# Altium schematic sheet a0206-2006.5.SchDoc
size 558 x 431 mm
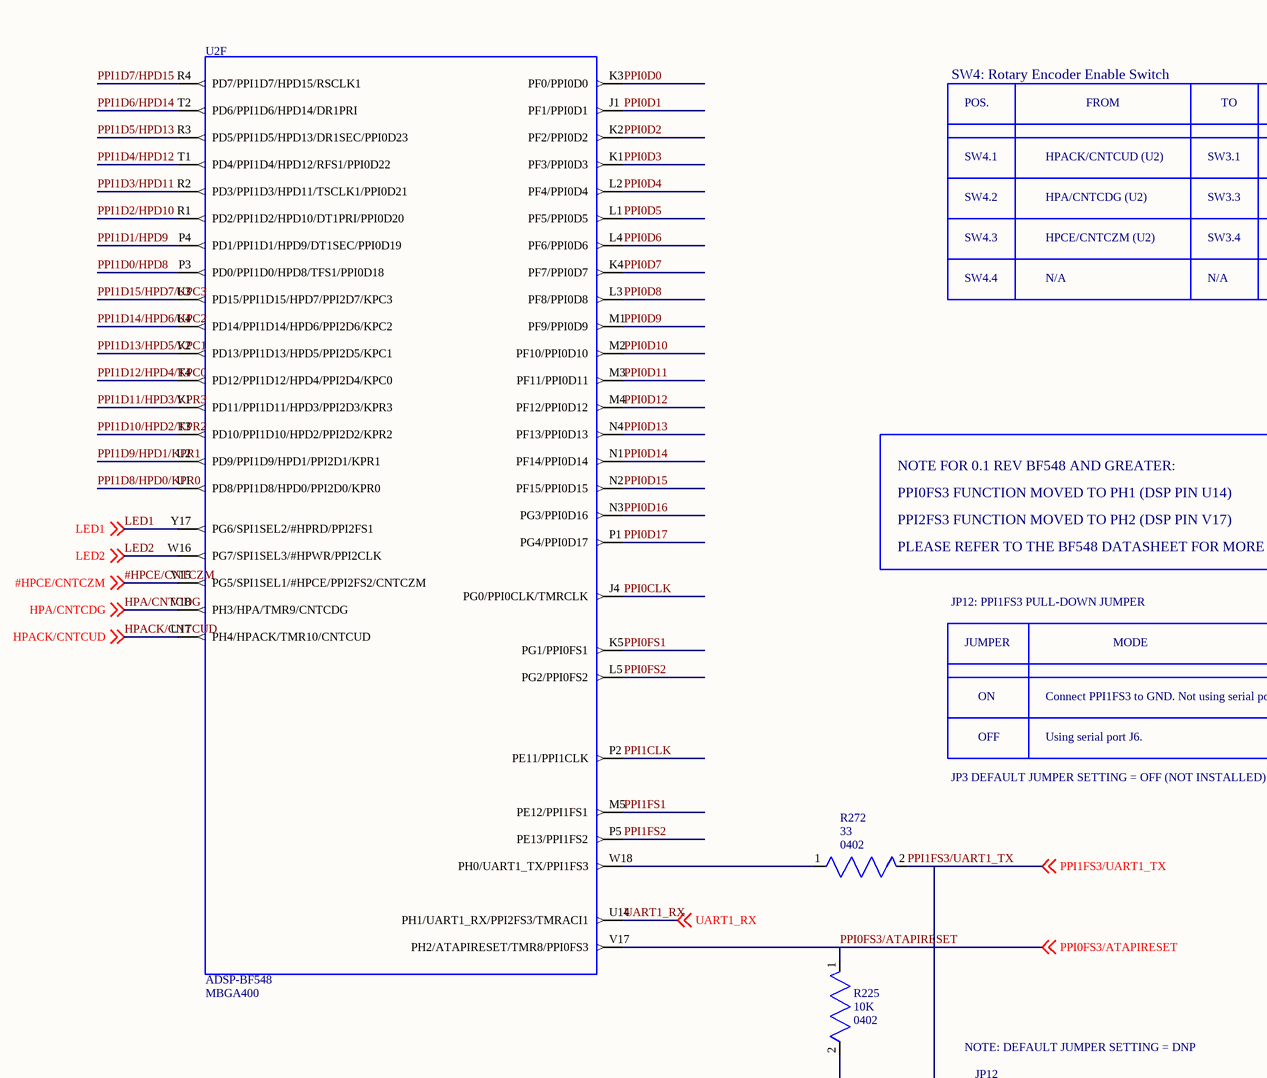
[diagram p0: a0206-2006.5.SchDoc, top left]
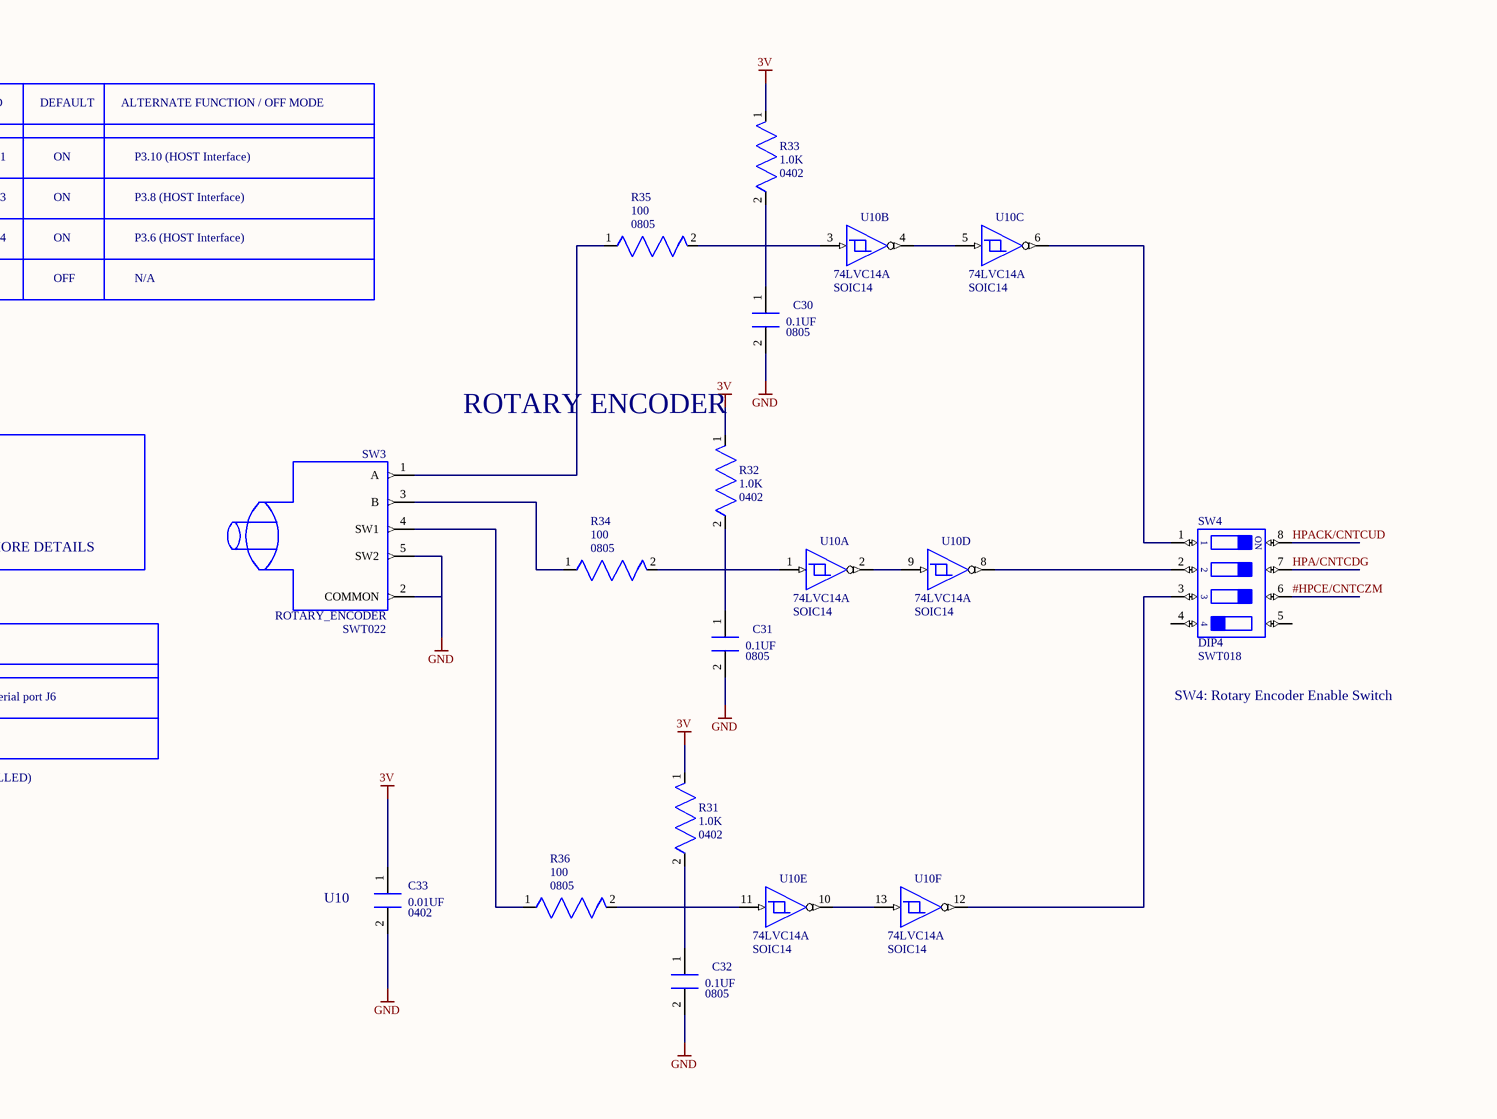
[diagram p1: a0206-2006.5.SchDoc, top right]
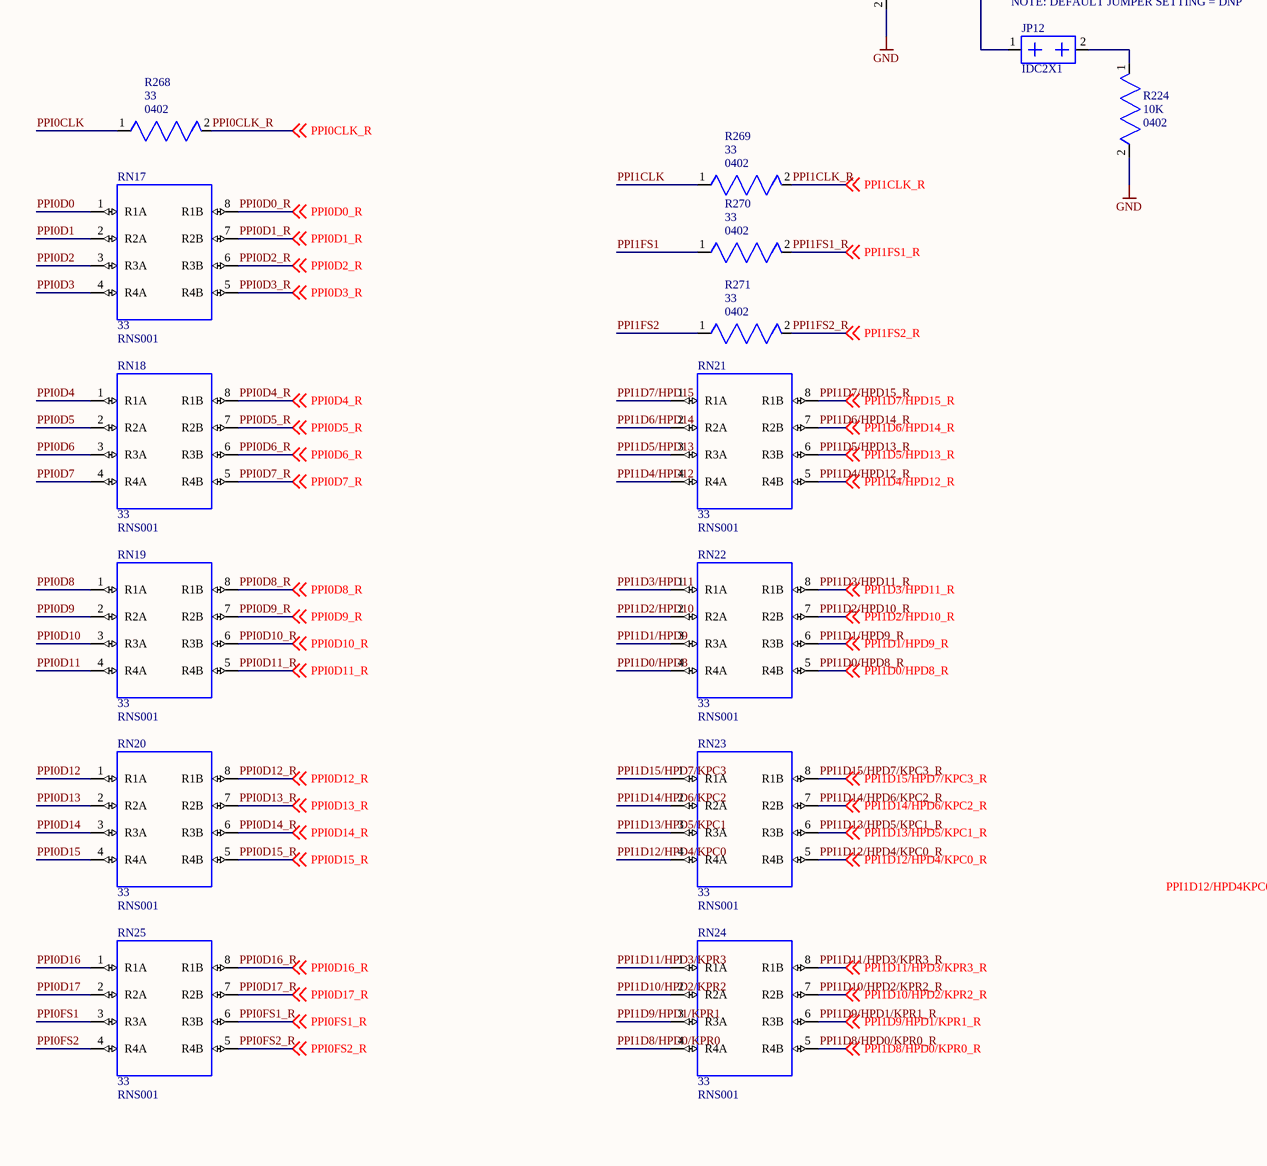
[diagram p2: a0206-2006.5.SchDoc, bottom left]
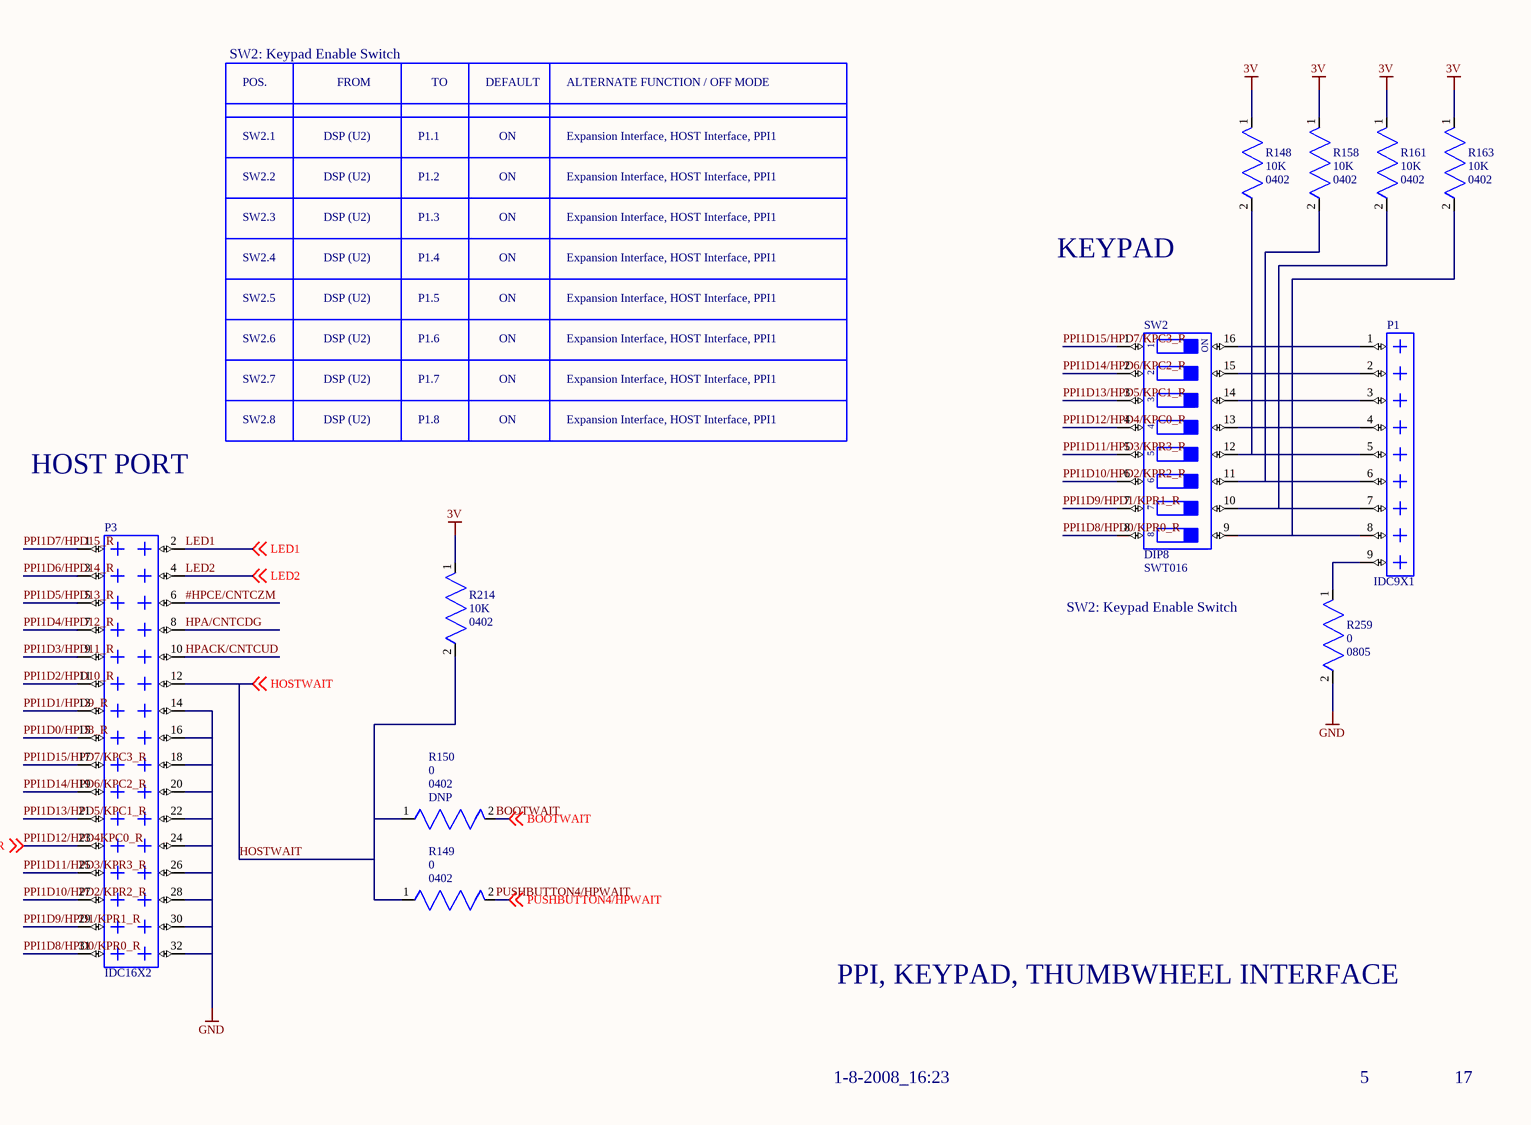
[diagram p3: a0206-2006.5.SchDoc, bottom right]

## Parts
C30  value 0.1UF  [0805]  (hidden comment: *)
C31  value 0.1UF  [0805]  (hidden comment: *)
C32  value 0.1UF  [0805]  (hidden comment: *)
C33  value 0.01UF  [0402]  (hidden comment: *)
JP12  *  [IDC2X1]  (value not drawn)
P1  *  [IDC9X1]  (value not drawn)
P3  *  [IDC16X2]  (value not drawn)
R31  value 1.0K  [0402]  (hidden comment: *)
R32  value 1.0K  [0402]  (hidden comment: *)
R33  value 1.0K  [0402]  (hidden comment: *)
R34  value 100  [0805]  (hidden comment: *)
R35  value 100  [0805]  (hidden comment: *)
R36  value 100  [0805]  (hidden comment: *)
R148  value 10K  [0402]  (hidden comment: *)
R149  value 0  [0402]  (hidden comment: *)
R150  value 0  CLASS: DNP  [0402]  (hidden comment: *)
R158  value 10K  [0402]  (hidden comment: *)
R161  value 10K  [0402]  (hidden comment: *)
R163  value 10K  [0402]  (hidden comment: *)
R214  value 10K  [0402]  (hidden comment: *)
R224  value 10K  [0402]  (hidden comment: *)
R225  value 10K  [0402]  (hidden comment: *)
R259  value 0  [0805]  (hidden comment: *)
R268  value 33  [0402]  (hidden comment: *)
R269  value 33  [0402]  (hidden comment: *)
R270  value 33  [0402]  (hidden comment: *)
R271  value 33  [0402]  (hidden comment: *)
R272  value 33  [0402]  (hidden comment: *)
RN17  value 33  [RNS001]  (hidden comment: *)
RN18  value 33  [RNS001]  (hidden comment: *)
RN19  value 33  [RNS001]  (hidden comment: *)
RN20  value 33  [RNS001]  (hidden comment: *)
RN21  value 33  [RNS001]  (hidden comment: *)
RN22  value 33  [RNS001]  (hidden comment: *)
RN23  value 33  [RNS001]  (hidden comment: *)
RN24  value 33  [RNS001]  (hidden comment: *)
RN25  value 33  [RNS001]  (hidden comment: *)
SW2  value DIP8  [SWT016]  (hidden comment: *)
SW3  value ROTARY_ENCODER  [SWT022]  (hidden comment: *)
SW4  value DIP4  [SWT018]  (hidden comment: *)
U2  PART: ADSP-BF548  PKG_TYPE: MBGA400  (hidden comment: ICS_ADSPBF548)  (part F of 7)
U10  PART: 74LVC14A  [SOIC14]  (hidden comment: *)  (parts A,B,C,D,E,F of 6)

## Nets
3V: C33.1(A) R31.1(N1) R32.1(N1) R33.1(N1) R148.1(N1) R158.1(N1) R161.1(N1) R163.1(N1) R214.1(N1) U10.14(3V)
GND: C30.2(B) C31.2(B) C32.2(B) C33.2(B) P3.14 P3.16 P3.18 P3.20 P3.22 P3.24 P3.26 P3.28 P3.30 P3.32 R224.2(N2) R225.2(N2) R259.2(N2) SW3.2(COMMON) SW3.5(SW2) U10.7(GND)
#HPCE/CNTCZM: P3.6 SW4.6 U2.V15(PG5/SPI1SEL1/#HPCE/PPI2FS2/CNTCZM) ; off-sheet #HPCE/CNTCZM
BOOTWAIT: R150.2(N2) ; off-sheet BOOTWAIT
HOSTWAIT: P3.12 R149.1(N1) R150.1(N1) R214.2(N2) ; off-sheet HOSTWAIT
HPA/CNTCDG: P3.8 SW4.7 U2.V18(PH3/HPA/TMR9/CNTCDG) ; off-sheet HPA/CNTCDG
HPACK/CNTCUD: P3.10 SW4.8 U2.U17(PH4/HPACK/TMR10/CNTCUD) ; off-sheet HPACK/CNTCUD
LED1: P3.2 U2.Y17(PG6/SPI1SEL2/#HPRD/PPI2FS1) ; off-sheet LED1
LED2: P3.4 U2.W16(PG7/SPI1SEL3/#HPWR/PPI2CLK) ; off-sheet LED2
PPI0CLK: R268.1(N1) U2.J4(PG0/PPI0CLK/TMRCLK)
PPI0CLK_R: R268.2(N2) ; off-sheet PPI0CLK_R
PPI0D0: RN17.1(R1A) U2.K3(PF0/PPI0D0)
PPI0D0_R: RN17.8(R1B) ; off-sheet PPI0D0_R
PPI0D1: RN17.2(R2A) U2.J1(PF1/PPI0D1)
PPI0D1_R: RN17.7(R2B) ; off-sheet PPI0D1_R
PPI0D2: RN17.3(R3A) U2.K2(PF2/PPI0D2)
PPI0D2_R: RN17.6(R3B) ; off-sheet PPI0D2_R
PPI0D3: RN17.4(R4A) U2.K1(PF3/PPI0D3)
PPI0D3_R: RN17.5(R4B) ; off-sheet PPI0D3_R
PPI0D4: RN18.1(R1A) U2.L2(PF4/PPI0D4)
PPI0D4_R: RN18.8(R1B) ; off-sheet PPI0D4_R
PPI0D5: RN18.2(R2A) U2.L1(PF5/PPI0D5)
PPI0D5_R: RN18.7(R2B) ; off-sheet PPI0D5_R
PPI0D6: RN18.3(R3A) U2.L4(PF6/PPI0D6)
PPI0D6_R: RN18.6(R3B) ; off-sheet PPI0D6_R
PPI0D7: RN18.4(R4A) U2.K4(PF7/PPI0D7)
PPI0D7_R: RN18.5(R4B) ; off-sheet PPI0D7_R
PPI0D8: RN19.1(R1A) U2.L3(PF8/PPI0D8)
PPI0D8_R: RN19.8(R1B) ; off-sheet PPI0D8_R
PPI0D9: RN19.2(R2A) U2.M1(PF9/PPI0D9)
PPI0D9_R: RN19.7(R2B) ; off-sheet PPI0D9_R
PPI0D10: RN19.3(R3A) U2.M2(PF10/PPI0D10)
PPI0D10_R: RN19.6(R3B) ; off-sheet PPI0D10_R
PPI0D11: RN19.4(R4A) U2.M3(PF11/PPI0D11)
PPI0D11_R: RN19.5(R4B) ; off-sheet PPI0D11_R
PPI0D12: RN20.1(R1A) U2.M4(PF12/PPI0D12)
PPI0D12_R: RN20.8(R1B) ; off-sheet PPI0D12_R
PPI0D13: RN20.2(R2A) U2.N4(PF13/PPI0D13)
PPI0D13_R: RN20.7(R2B) ; off-sheet PPI0D13_R
PPI0D14: RN20.3(R3A) U2.N1(PF14/PPI0D14)
PPI0D14_R: RN20.6(R3B) ; off-sheet PPI0D14_R
PPI0D15: RN20.4(R4A) U2.N2(PF15/PPI0D15)
PPI0D15_R: RN20.5(R4B) ; off-sheet PPI0D15_R
PPI0D16: RN25.1(R1A) U2.N3(PG3/PPI0D16)
PPI0D16_R: RN25.8(R1B) ; off-sheet PPI0D16_R
PPI0D17: RN25.2(R2A) U2.P1(PG4/PPI0D17)
PPI0D17_R: RN25.7(R2B) ; off-sheet PPI0D17_R
PPI0FS1: RN25.3(R3A) U2.K5(PG1/PPI0FS1)
PPI0FS1_R: RN25.6(R3B) ; off-sheet PPI0FS1_R
PPI0FS2: RN25.4(R4A) U2.L5(PG2/PPI0FS2)
PPI0FS2_R: RN25.5(R4B) ; off-sheet PPI0FS2_R
PPI0FS3/ATAPIRESET: R225.1(N1) U2.V17(PH2/ATAPIRESET/TMR8/PPI0FS3) ; off-sheet PPI0FS3/ATAPIRESET
PPI1CLK: R269.1(N1) U2.P2(PE11/PPI1CLK)
PPI1CLK_R: R269.2(N2) ; off-sheet PPI1CLK_R
PPI1D0/HPD8: RN22.4(R4A) U2.P3(PD0/PPI1D0/HPD8/TFS1/PPI0D18)
PPI1D0/HPD8_R: P3.15 RN22.5(R4B) ; off-sheet PPI1D0/HPD8_R
PPI1D1/HPD9: RN22.3(R3A) U2.P4(PD1/PPI1D1/HPD9/DT1SEC/PPI0D19)
PPI1D1/HPD9_R: P3.13 RN22.6(R3B) ; off-sheet PPI1D1/HPD9_R
PPI1D2/HPD10: RN22.2(R2A) U2.R1(PD2/PPI1D2/HPD10/DT1PRI/PPI0D20)
PPI1D2/HPD10_R: P3.11 RN22.7(R2B) ; off-sheet PPI1D2/HPD10_R
PPI1D3/HPD11: RN22.1(R1A) U2.R2(PD3/PPI1D3/HPD11/TSCLK1/PPI0D21)
PPI1D3/HPD11_R: P3.9 RN22.8(R1B) ; off-sheet PPI1D3/HPD11_R
PPI1D4/HPD12: RN21.4(R4A) U2.T1(PD4/PPI1D4/HPD12/RFS1/PPI0D22)
PPI1D4/HPD12_R: P3.7 RN21.5(R4B) ; off-sheet PPI1D4/HPD12_R
PPI1D5/HPD13: RN21.3(R3A) U2.R3(PD5/PPI1D5/HPD13/DR1SEC/PPI0D23)
PPI1D5/HPD13_R: P3.5 RN21.6(R3B) ; off-sheet PPI1D5/HPD13_R
PPI1D6/HPD14: RN21.2(R2A) U2.T2(PD6/PPI1D6/HPD14/DR1PRI)
PPI1D6/HPD14_R: P3.3 RN21.7(R2B) ; off-sheet PPI1D6/HPD14_R
PPI1D7/HPD15: RN21.1(R1A) U2.R4(PD7/PPI1D7/HPD15/RSCLK1)
PPI1D7/HPD15_R: P3.1 RN21.8(R1B) ; off-sheet PPI1D7/HPD15_R
PPI1D8/HPD0/KPR0: RN24.4(R4A) U2.U1(PD8/PPI1D8/HPD0/PPI2D0/KPR0)
PPI1D8/HPD0/KPR0_R: P3.31 RN24.5(R4B) SW2.8 ; off-sheet PPI1D8/HPD0/KPR0_R
PPI1D9/HPD1/KPR1: RN24.3(R3A) U2.U2(PD9/PPI1D9/HPD1/PPI2D1/KPR1)
PPI1D9/HPD1/KPR1_R: P3.29 RN24.6(R3B) SW2.7 ; off-sheet PPI1D9/HPD1/KPR1_R
PPI1D10/HPD2/KPR2: RN24.2(R2A) U2.T3(PD10/PPI1D10/HPD2/PPI2D2/KPR2)
PPI1D10/HPD2/KPR2_R: P3.27 RN24.7(R2B) SW2.6 ; off-sheet PPI1D10/HPD2/KPR2_R
PPI1D11/HPD3/KPR3: RN24.1(R1A) U2.V1(PD11/PPI1D11/HPD3/PPI2D3/KPR3)
PPI1D11/HPD3/KPR3_R: P3.25 RN24.8(R1B) SW2.5 ; off-sheet PPI1D11/HPD3/KPR3_R
PPI1D12/HPD4/KPC0: RN23.4(R4A) U2.T4(PD12/PPI1D12/HPD4/PPI2D4/KPC0)
PPI1D12/HPD4/KPC0_R: RN23.5(R4B) SW2.4 ; off-sheet PPI1D12/HPD4/KPC0_R
PPI1D12/HPD4KPC0_R: P3.23 ; off-sheet PPI1D12/HPD4KPC0_R
PPI1D13/HPD5/KPC1: RN23.3(R3A) U2.V2(PD13/PPI1D13/HPD5/PPI2D5/KPC1)
PPI1D13/HPD5/KPC1_R: P3.21 RN23.6(R3B) SW2.3 ; off-sheet PPI1D13/HPD5/KPC1_R
PPI1D14/HPD6/KPC2: RN23.2(R2A) U2.U4(PD14/PPI1D14/HPD6/PPI2D6/KPC2)
PPI1D14/HPD6/KPC2_R: P3.19 RN23.7(R2B) SW2.2 ; off-sheet PPI1D14/HPD6/KPC2_R
PPI1D15/HPD7/KPC3: RN23.1(R1A) U2.U3(PD15/PPI1D15/HPD7/PPI2D7/KPC3)
PPI1D15/HPD7/KPC3_R: P3.17 RN23.8(R1B) SW2.1 ; off-sheet PPI1D15/HPD7/KPC3_R
PPI1FS1: R270.1(N1) U2.M5(PE12/PPI1FS1)
PPI1FS1_R: R270.2(N2) ; off-sheet PPI1FS1_R
PPI1FS2: R271.1(N1) U2.P5(PE13/PPI1FS2)
PPI1FS2_R: R271.2(N2) ; off-sheet PPI1FS2_R
PPI1FS3/UART1_TX: JP12.1 R272.2(N2) ; off-sheet PPI1FS3/UART1_TX
PUSHBUTTON4/HPWAIT: R149.2(N2) ; off-sheet PUSHBUTTON4/HPWAIT
UART1_RX: U2.U14(PH1/UART1_RX/PPI2FS3/TMRACI1) ; off-sheet UART1_RX
NetC30_1: C30.1(A) R33.2(N2) R35.2(N2) U10.3(A)
NetC31_1: C31.1(A) R32.2(N2) R34.2(N2) U10.1(A)
NetC32_1: C32.1(A) R31.2(N2) R36.2(N2) U10.11(A)
NetJP12_2: JP12.2 R224.1(N1)
NetP1_1: P1.1 SW2.16
NetP1_2: P1.2 SW2.15
NetP1_3: P1.3 SW2.14
NetP1_4: P1.4 SW2.13
NetP1_5: P1.5 R148.2(N2) SW2.12
NetP1_6: P1.6 R158.2(N2) SW2.11
NetP1_7: P1.7 R161.2(N2) SW2.10
NetP1_8: P1.8 R163.2(N2) SW2.9
NetP1_9: P1.9 R259.1(N1)
NetR34_1: R34.1(N1) SW3.3(B)
NetR35_1: R35.1(N1) SW3.1(A)
NetR36_1: R36.1(N1) SW3.4(SW1)
NetR272_1: R272.1(N1) U2.W18(PH0/UART1_TX/PPI1FS3)
NetSW4_1: SW4.1 U10.6(Y)
NetSW4_2: SW4.2 U10.8(Y)
NetSW4_3: SW4.3 U10.12(Y)
NetU10_2: U10.2(Y) U10.9(A)
NetU10_4: U10.4(Y) U10.5(A)
NetU10_10: U10.10(Y) U10.13(A)

Not connected (* = marked no-connect by the designer): SW4 4 5

## Notes on the sheet
- SW4: Rotary Encoder Enable Switch
- SW4.1
- POS.
- HPACK/CNTCUD (U2)
- FROM
- SW3.1
- TO
- DEFAULT
- ON
- ALTERNATE FUNCTION / OFF MODE
- P3.10 (HOST Interface)
- SW4.2
- HPA/CNTCDG (U2)
- SW3.3
- P3.8 (HOST Interface)
- SW4.3
- SW4.4
- N/A
- HPCE/CNTCZM (U2)
- SW3.4
- OFF
- P3.6 (HOST Interface)
- ROTARY ENCODER
- PPI0FS3 FUNCTION MOVED TO PH1 (DSP PIN U14)
- NOTE FOR 0.1 REV BF548 AND GREATER:
- PPI2FS3 FUNCTION MOVED TO PH2 (DSP PIN V17)
- PLEASE REFER TO THE BF548 DATASHEET FOR MORE DETAILS
- JP12: PPI1FS3 PULL-DOWN JUMPER
- JUMPER
- Connect PPI1FS3 to GND. Not using serial port J6
- MODE
- Using serial port J6.
- JP3 DEFAULT JUMPER SETTING = OFF (NOT INSTALLED)
- (near C33) U10
- NOTE: DEFAULT JUMPER SETTING = DNP
- SW2: Keypad Enable Switch
- SW2.1
- DSP (U2)
- P1.1
- Expansion Interface, HOST Interface, PPI1
- SW2.2
- SW2.3
- P1.2
- P1.3
- SW2.4
- P1.4
- KEYPAD
- SW2.5
- SW2.6
- P1.5
- P1.6
- SW2.7
- SW2.8
- P1.7
- P1.8
- HOST PORT
- PPI, KEYPAD, THUMBWHEEL INTERFACE
- 1-8-2008_16:23
- 5
- 17
- A
- B
- C
- D
- 1
- 2
- 3
- 20 Cotton Road
- 4
- DEVICES
- ANALOG
- Nashua, NH 03063
- PH: 1-800-ANALOGD
- Title
- ADSP-BF548 EZ-KIT LITE
- Size
- Board No.
- A0206-2006
- Rev
- 1.4B
- Date
- Sheet
- of
- (in symbol SW_DIP4.1) ON
- (in symbol SW_DIP8.1) ON

## Library data of the parts
C30 C32 = CAP_NON_POLARIZED.2: PART_SPEC: CAPACITOR; LEVEL: STD; TYPE: X7R; TOLERANCE: 10%; VOLTAGE: 50V; PRT_NUM: 7000034; BOARDS: BOTH; PKG_TYPE: 0805; ROHS: ROHS
C31 = CAP_NON_POLARIZED.2: PART_SPEC: CAPACITOR; LEVEL: STD; TYPE: X7R; PRT_NUM: 7000034; VOLTAGE: 50V; TOLERANCE: 10%; BOARDS: BOTH; PKG_TYPE: 0805; ROHS: ROHS
C33 = CAP_NON_POLARIZED.2: PART_SPEC: CAPACITOR; LEVEL: STD; TYPE: X7R; BOARDS: BOTH; PRT_NUM: 7000279; VOLTAGE: 16V; TOLERANCE: 10%; PKG_TYPE: 0402; ROHS: ROHS
JP12 = CON_JP_2X1.2: HEADER; PART_SPEC: CONNECTOR; LEVEL: STD; PRT_NUM: 6000774; CONFIGURATION: 2X1; PKG_TYPE: IDC2X1; TYPE: IDC; ROHS: ROHS
P1 = CON_9X1.1: SOCKET; PART_SPEC: CONNECTOR; LEVEL: STD; CONFIGURATION: 9X1; PRT_NUM: 6000839; PKG_TYPE: IDC9X1; ROHS: ROHS; TYPE: IDC
P3 = CON_16X2.1: HEADER; PART_SPEC: CONNECTOR; LEVEL: STD; PRT_NUM: 6000827; CONFIGURATION: 16X2; PKG_TYPE: IDC16X2; TYPE: IDC; ROHS: ROHS
R31-R33 = RES_STANDARD.2: PART_SPEC: RESISTOR; LEVEL: STD; POWER: 1/16W; BOARDS: BOTH; TOLERANCE: 1%; PRT_NUM: 7000571; PKG_TYPE: 0402; ROHS: ROHS
R34 = RES_STANDARD.1: PART_SPEC: RESISTOR; LEVEL: STD; POWER: 1/10W; BOARDS: BOTH; TOLERANCE: 5%; PRT_NUM: 7000097; PKG_TYPE: 0805; ROHS: ROHS
R35 R36 = RES_STANDARD.1: PART_SPEC: RESISTOR; LEVEL: STD; POWER: 1/10W; BOARDS: BOTH; PRT_NUM: 7000097; TOLERANCE: 5%; PKG_TYPE: 0805; ROHS: ROHS
R148 R161 R224 = RES_STANDARD.2: PART_SPEC: RESISTOR; LEVEL: STD; PRT_NUM: 7000280; TOLERANCE: 5%; BOARDS: BOTH; POWER: 1/16W; PKG_TYPE: 0402; ROHS: ROHS
R149 = RES_STANDARD.1: PART_SPEC: RESISTOR; LEVEL: STD; PRT_NUM: 7000282; POWER: 1/16W; TOLERANCE: 5%; PKG_TYPE: 0402; ROHS: ROHS
R150 = RES_STANDARD.1: PART_SPEC: RESISTOR; LEVEL: STD; TOLERANCE: 5%; POWER: 1/16W; PRT_NUM: 7000282; PKG_TYPE: 0402; ROHS: ROHS
R158 R163 R214 R225 = RES_STANDARD.2: PART_SPEC: RESISTOR; LEVEL: STD; POWER: 1/16W; BOARDS: BOTH; TOLERANCE: 5%; PRT_NUM: 7000280; PKG_TYPE: 0402; ROHS: ROHS
R259 = RES_STANDARD.2: PART_SPEC: RESISTOR; LEVEL: STD; TOLERANCE: 5%; POWER: 1/10W; PRT_NUM: 7000228; PKG_TYPE: 0805; ROHS: ROHS
R268 R270 R272 = RES_STANDARD.1: PART_SPEC: RESISTOR; LEVEL: STD; PRT_NUM: 7000285; POWER: 1/16W; TOLERANCE: 5%; PKG_TYPE: 0402; ROHS: ROHS
R269 R271 = RES_STANDARD.1: PART_SPEC: RESISTOR; LEVEL: STD; TOLERANCE: 5%; POWER: 1/16W; PRT_NUM: 7000285; PKG_TYPE: 0402; ROHS: ROHS
RN17 RN19 RN22 RN24 = RNET_4SERIES.1: SERIES; PART_SPEC: RESISTOR_NETWORK; LEVEL: STD; PRT_NUM: 7000558; TOLERANCE: 5%; POWER: 125MW; PKG_TYPE: RNS001; ROHS: ROHS
RN18 RN20 RN21 RN23 RN25 = RNET_4SERIES.1: SERIES; PART_SPEC: RESISTOR_NETWORK; LEVEL: STD; PRT_NUM: 7000558; POWER: 125MW; TOLERANCE: 5%; PKG_TYPE: RNS001; ROHS: ROHS
SW2 = SW_DIP8.1: PART_SPEC: SWITCH; LEVEL: STD; PRT_NUM: 6000128; PKG_TYPE: SWT016; ROHS: ROHS
SW3 = SW_THUMBWHEEL.1: LEVEL: STD; PRT_NUM: 6000823; PKG_TYPE: SWT022; ROHS: ROHS
SW4 = SW_DIP4.1: PART_SPEC: SWITCH; LEVEL: STD; PRT_NUM: 6000144; PKG_TYPE: SWT018; ROHS: ROHS
U2 = ICS_ADSPBF548_A: 600 MHZ; LEVEL: STD; PRT_NUM: 30-025548-02; DEVICE: ICS_ADSPBF548; ROHS: ROHS; WEB: http://www.analog.com/en/prod/0,2877,ADSP%252DBF548,00.html
U10 = ICS_SN74XXX14.1: HEX-INVER-SCHMITT-TRIGGER; LEVEL: STD; BOARDS: BOTH; PRT_NUM: 1000097; PKG_TYPE: SOIC14; WEB: http://focus.ti.com/docs/prod/folders/print/sn74lvc14a.html; ROHS: ROHS